# Altium schematic sheet 10_UART_USB.SchDoc
size A3
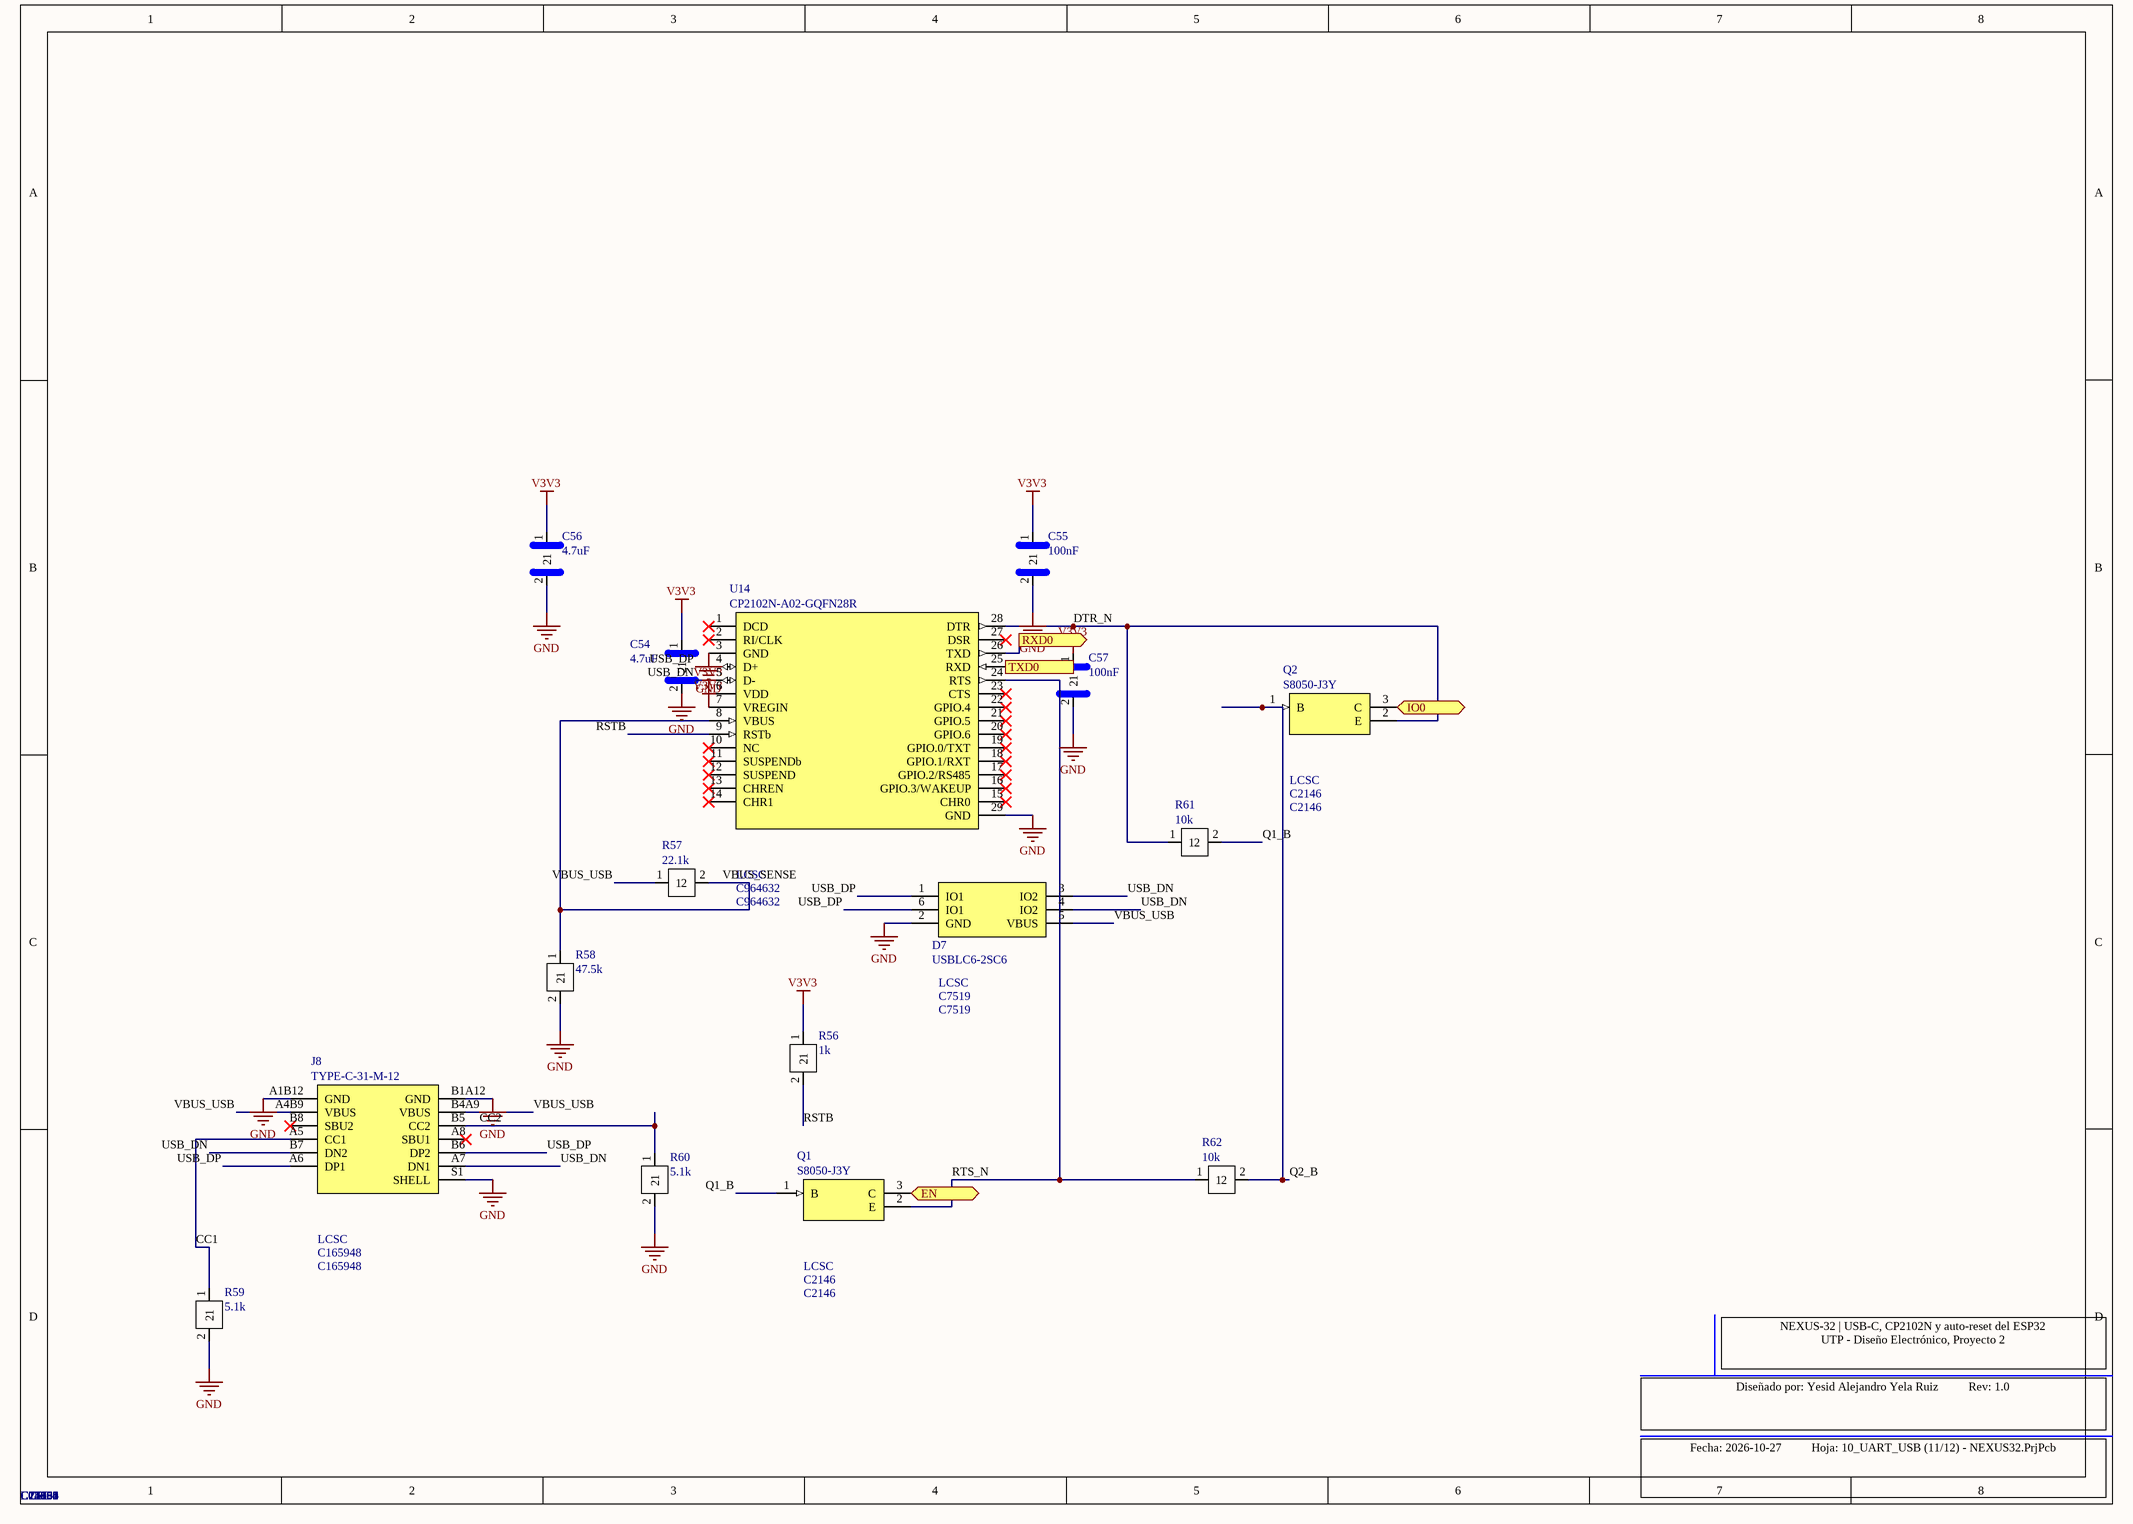
[diagram p0: 10_UART_USB.SchDoc]

## Parts
C54  4.7uF  Supplier 1: LCSC  Supplier Part Number 1: C1705  [R_0603]
C55  100nF  Supplier 1: LCSC  Supplier Part Number 1: C14663  [R_0603]
C56  4.7uF  Supplier 1: LCSC  Supplier Part Number 1: C1705  [R_0603]
C57  100nF  Supplier 1: LCSC  Supplier Part Number 1: C14663  [R_0603]
D7  USBLC6-2SC6  Supplier 1: LCSC  Supplier Part Number 1: C7519  [SOT-23-6_USBLC6]
J8  TYPE-C-31-M-12  Supplier 1: LCSC  Supplier Part Number 1: C165948  [USB-C_TYPE-C-31-M-12]
Q1  S8050-J3Y  Supplier 1: LCSC  Supplier Part Number 1: C2146  [SOT-23-3_DBZ]
Q2  S8050-J3Y  Supplier 1: LCSC  Supplier Part Number 1: C2146  [SOT-23-3_DBZ]
R56  1k  Supplier 1: LCSC  Supplier Part Number 1: C21190  [R_0603]
R57  22.1k  Supplier 1: LCSC  Supplier Part Number 1: C25961  [R_0603]
R58  47.5k  Supplier 1: LCSC  Supplier Part Number 1: C23061  [R_0603]
R59  5.1k  Supplier 1: LCSC  Supplier Part Number 1: C23186  [R_0603]
R60  5.1k  Supplier 1: LCSC  Supplier Part Number 1: C23186  [R_0603]
R61  10k  Supplier 1: LCSC  Supplier Part Number 1: C25804  [R_0603]
R62  10k  Supplier 1: LCSC  Supplier Part Number 1: C25804  [R_0603]
U14  CP2102N-A02-GQFN28R  Supplier 1: LCSC  Supplier Part Number 1: C964632  [QFN-28-EP_5x5_P0.5]

## Ports
EN (bidir), IO0 (bidir), RXD0 (out), TXD0 (in)

## Nets
GND: C54.2 C55.2 C56.2 C57.2 D7.2(GND) J8.A1B12(GND) J8.B1A12(GND) J8.S1(SHELL) R58.2 R59.2 R60.2 U14.3(GND) U14.29(GND)
V3V3: C54.1 C55.1 C56.1 C57.1 R56.1 U14.6(VDD) U14.7(VREGIN)
CC1: J8.A5(CC1) R59.1
CC2: J8.B5(CC2) R60.1
DTR_N: Q2.2(E) R61.1 U14.28(DTR)
EN: Q1.3(C) ; port EN
IO0: Q2.3(C) ; port IO0
Q1_B: Q1.1(B) R61.2
Q2_B: Q2.1(B) R62.2
RSTB: R56.2 U14.9(RSTb)
RTS_N: Q1.2(E) R62.1 U14.24(RTS)
RXD0: U14.26(TXD) ; port RXD0
TXD0: U14.25(RXD) ; port TXD0
USB_DN: D7.3(IO2) D7.4(IO2) J8.A7(DN1) J8.B7(DN2) U14.5(D-)
USB_DP: D7.1(IO1) D7.6(IO1) J8.A6(DP1) J8.B6(DP2) U14.4(D+)
VBUS_SENSE: R57.2 R58.1 U14.8(VBUS)
VBUS_USB: D7.5(VBUS) J8.A4B9(VBUS) J8.B4A9(VBUS) R57.1

Not connected (* = marked no-connect by the designer): J8 A8(SBU1)* B8(SBU2)*; U14 1(DCD)* 2(RI/CLK)* 10(NC)* 11(SUSPENDb)* 12(SUSPEND)* 13(CHREN)* 14(CHR1)* 15(CHR0)* 16(GPIO.3/WAKEUP)* 17(GPIO.2/RS485)* 18(GPIO.1/RXT)* 19(GPIO.0/TXT)* 20(GPIO.6)* 21(GPIO.5)* 22(GPIO.4)* 23(CTS)* 27(DSR)*

## Notes on the sheet
- NEXUS-32 | USB-C, CP2102N y auto-reset del ESP32
  UTP - Diseño Electrónico, Proyecto 2
- Diseñado por: Yesid Alejandro Yela Ruiz          Rev: 1.0
- Fecha: 2026-10-27          Hoja: 10_UART_USB (11/12) - NEXUS32.PrjPcb

## Library data of the parts
C54 C56 = CAP_0603: Condensador ceramico SMD 0603; Manufacturer: Samsung; Manufacturer Part Number: CL10A475KP8NNNC; Datasheet: https://wmsc.lcsc.com/wmsc/upload/file/pdf/v2/lcsc/2206010045_UNI-ROYAL-Uniroyal-Elec-0603WAF1002T5E_C25804.pdf; LCSC Part #: C1705
C55 C57 = CAP_0603: Condensador ceramico SMD 0603; Manufacturer: YAGEO; Manufacturer Part Number: CC0603KRX7R9BB104; Datasheet: https://wmsc.lcsc.com/wmsc/upload/file/pdf/v2/lcsc/2206010045_UNI-ROYAL-Uniroyal-Elec-0603WAF1002T5E_C25804.pdf; LCSC Part #: C14663
D7 = USBLC6-2SC6: Proteccion ESD USB 2 lineas + VBUS SOT-23-6 (ST USBLC6-2SC6); Manufacturer: STMicroelectronics; Manufacturer Part Number: USBLC6-2SC6; LCSC Part #: C7519; Datasheet: https://wmsc.lcsc.com/wmsc/upload/file/pdf/v2/lcsc/2410121836_STMicroelectronics-USBLC6-2SC6_C7519.pdf
J8 = TYPE-C-31-M-12: Receptaculo USB Type-C 16 pines SMD (HRO TYPE-C-31-M-12); pads fusionados A1/B12, A4/B9, B4/A9, B1/A12; Manufacturer: Korean Hroparts Elec (HRO); Manufacturer Part Number: TYPE-C-31-M-12; LCSC Part #: C165948; Datasheet: https://wmsc.lcsc.com/wmsc/upload/file/pdf/v2/lcsc/2205251630_Korean-Hroparts-Elec-TYPE-C-31-M-12_C165948.pdf
Q1 Q2 = S8050-J3Y: Transistor NPN 25V 500mA SOT-23 (Changjing S8050 J3Y); Manufacturer: Jiangsu Changjing Electronics Technology (CJ); Manufacturer Part Number: S8050; LCSC Part #: C2146; Datasheet: https://wmsc.lcsc.com/wmsc/upload/file/pdf/v2/lcsc/2310131500_Jiangsu-Changjing-Electronics-Technology-Co---Ltd--S8050-J3Y-RANGE-200-350_C2146.pdf
R56 = RES_0603: Resistencia SMD 0603; Manufacturer: UNI-ROYAL; Manufacturer Part Number: 0603WAF1001T5E; Datasheet: https://wmsc.lcsc.com/wmsc/upload/file/pdf/v2/lcsc/2206010045_UNI-ROYAL-Uniroyal-Elec-0603WAF1002T5E_C25804.pdf; LCSC Part #: C21190
R57 = RES_0603: Resistencia SMD 0603; Manufacturer: UNI-ROYAL; Manufacturer Part Number: 0603WAF2212T5E; Datasheet: https://wmsc.lcsc.com/wmsc/upload/file/pdf/v2/lcsc/2206010045_UNI-ROYAL-Uniroyal-Elec-0603WAF1002T5E_C25804.pdf; LCSC Part #: C25961
R58 = RES_0603: Resistencia SMD 0603; Manufacturer: UNI-ROYAL; Manufacturer Part Number: 0603WAF4752T5E; Datasheet: https://wmsc.lcsc.com/wmsc/upload/file/pdf/v2/lcsc/2206010045_UNI-ROYAL-Uniroyal-Elec-0603WAF1002T5E_C25804.pdf; LCSC Part #: C23061
R59 R60 = RES_0603: Resistencia SMD 0603; Manufacturer: UNI-ROYAL; Manufacturer Part Number: 0603WAF5101T5E; Datasheet: https://wmsc.lcsc.com/wmsc/upload/file/pdf/v2/lcsc/2206010045_UNI-ROYAL-Uniroyal-Elec-0603WAF1002T5E_C25804.pdf; LCSC Part #: C23186
R61 R62 = RES_0603: Resistencia SMD 0603; Manufacturer: UNI-ROYAL; Manufacturer Part Number: 0603WAF1002T5E; Datasheet: https://wmsc.lcsc.com/wmsc/upload/file/pdf/v2/lcsc/2206010045_UNI-ROYAL-Uniroyal-Elec-0603WAF1002T5E_C25804.pdf; LCSC Part #: C25804
U14 = CP2102N-A02-GQFN28R: Puente USB a UART QFN-28 5x5 (Silicon Labs CP2102N-A02-GQFN28R); Manufacturer: Silicon Labs; Manufacturer Part Number: CP2102N-A02-GQFN28R; LCSC Part #: C964632; Datasheet: https://wmsc.lcsc.com/wmsc/upload/file/pdf/v2/lcsc/2304140030_SKYWORKS-SILICON-LABS-CP2102N-A02-GQFN28R_C964632.pdf